# Altium project PCB_control_board_main.PrjPcb
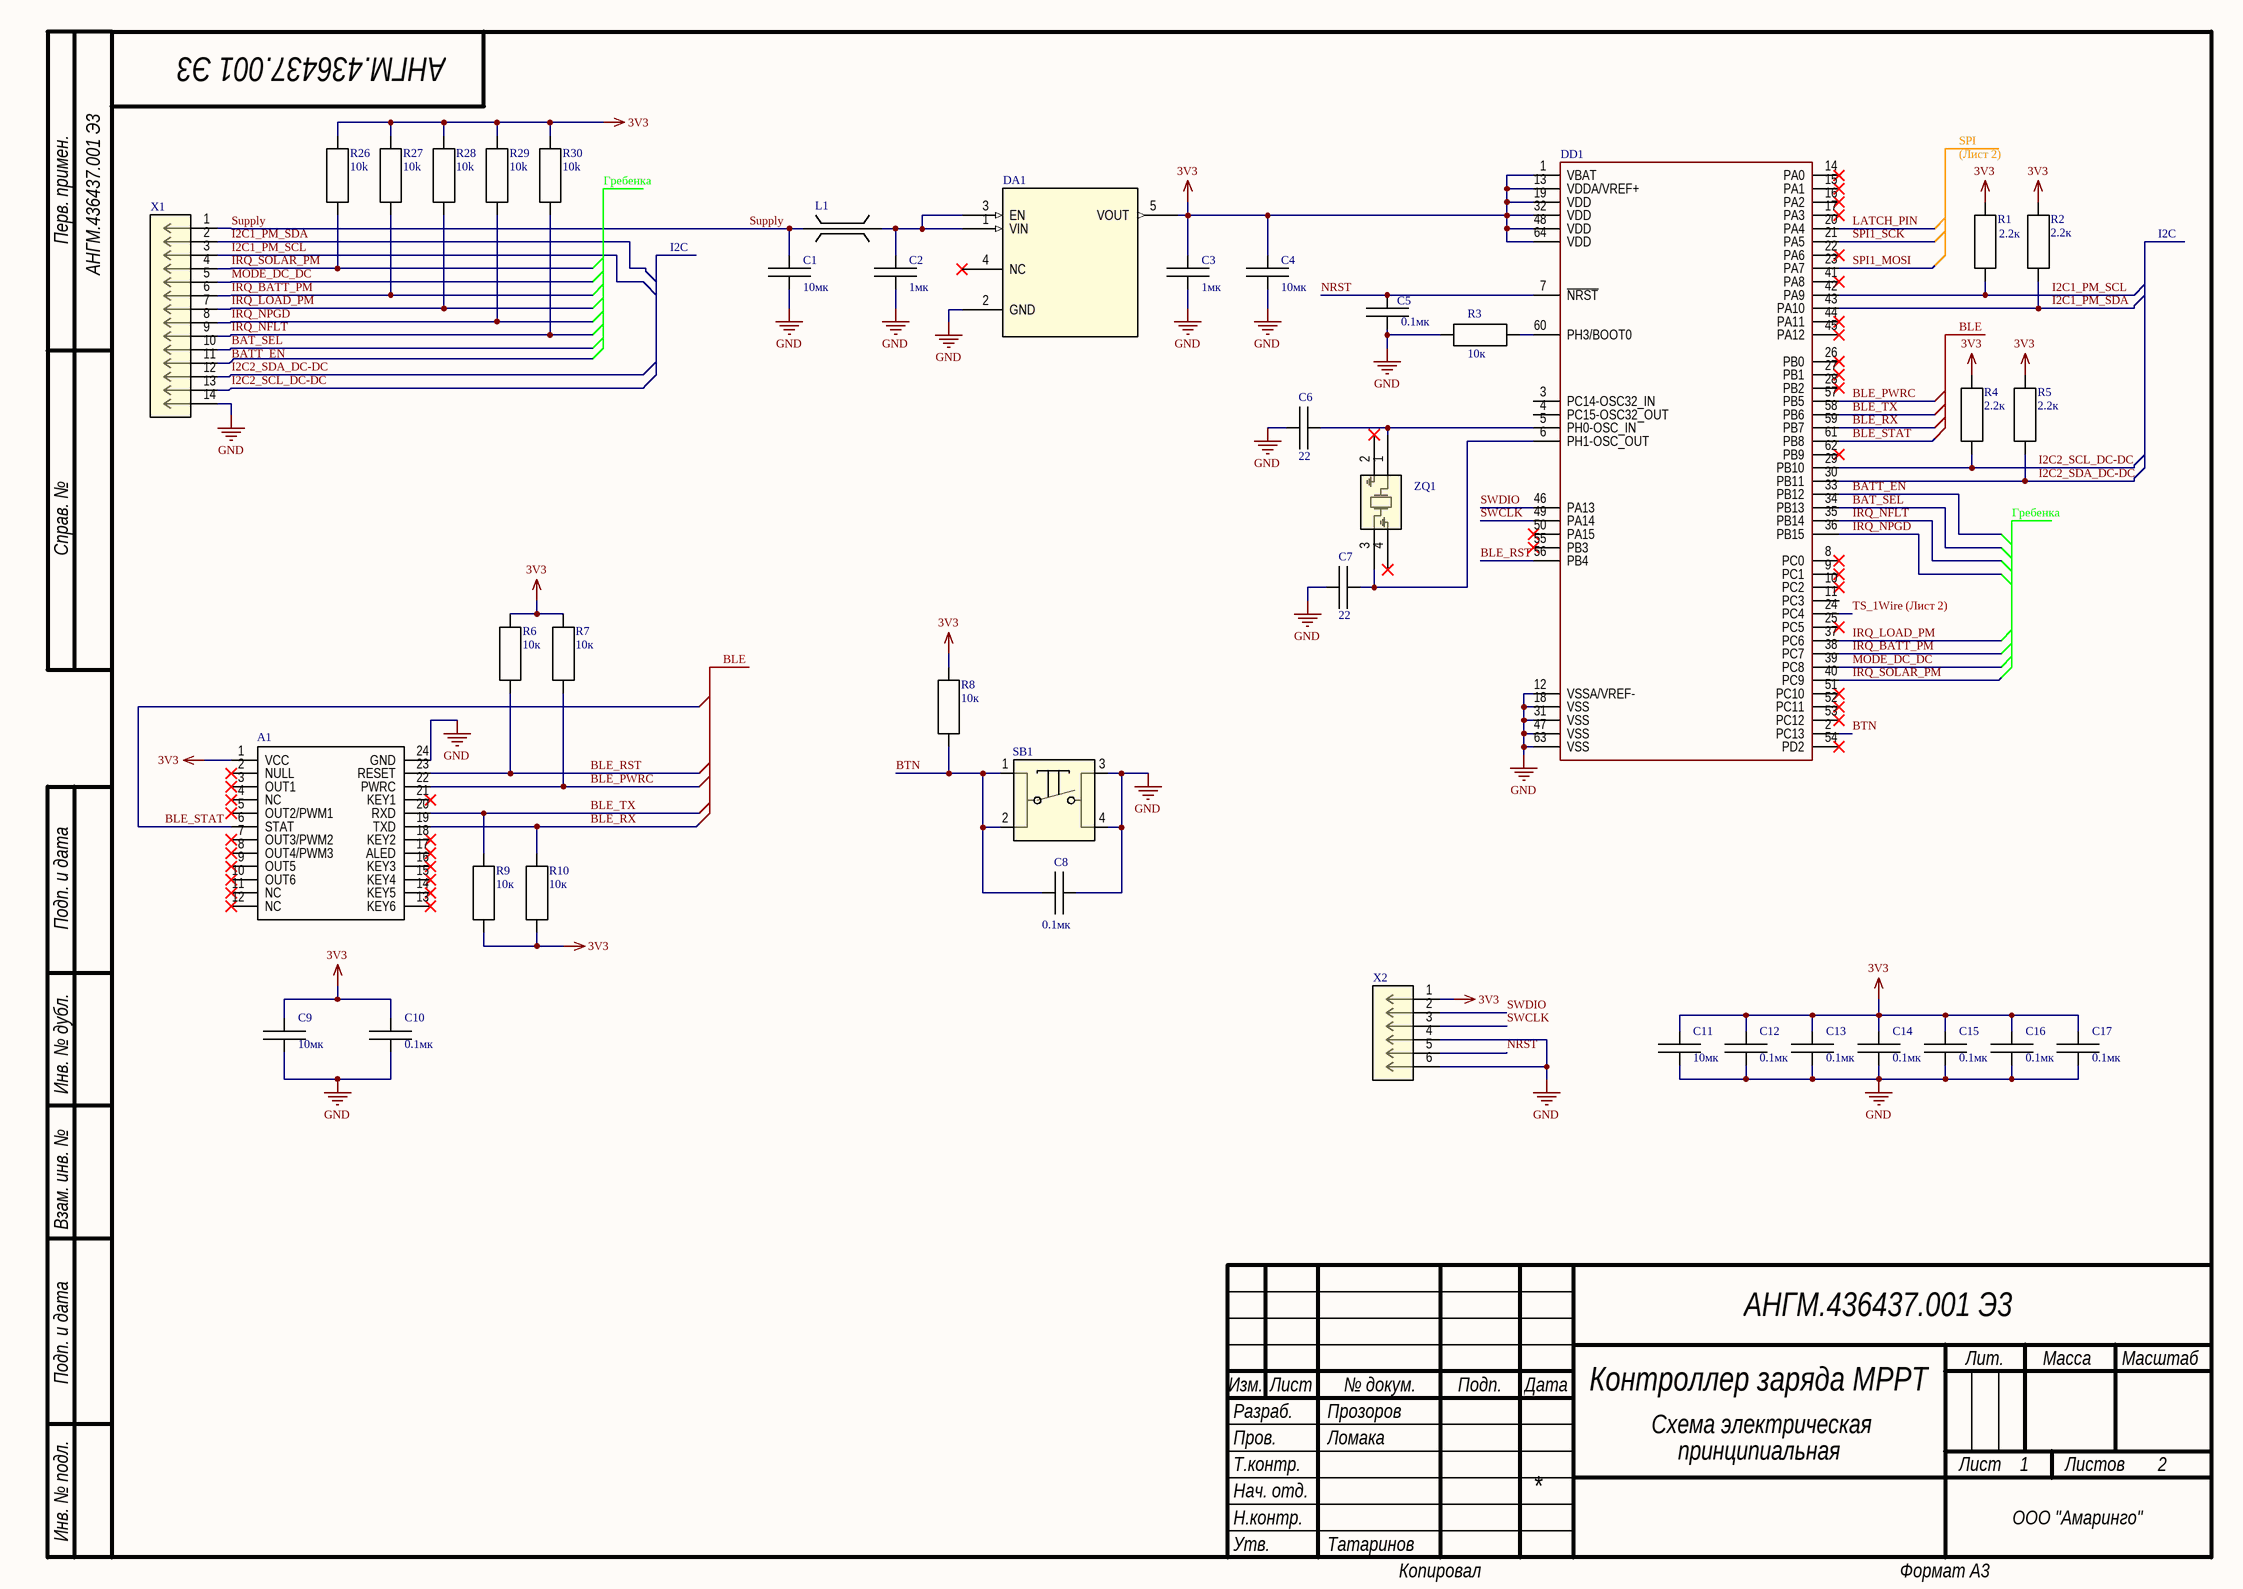
[diagram p0: stm32.SchDoc]
DecimalNumber: АНГО.436437.001; Вид_документа_SCH: Схема электрическая принципиальная; Графа 04 - Литера: О; Децимальный номер печатного узла: АНГО.436437.001; Код_документа_SCH: Э3; Компания: ООО "Амаринго"; Литера: О; Литера1: О; Наименование: Контроллер заряда MPPT; Наименование1: Контроллер заряда MPPT; Обозначение: АНГМ.436437.001; Обозначение_Код: АНГМ.436437.001Э3; Папка для сохранения графической документации: Документация; Папка для сохранения текстовой документации: Документация; Проверил: Ломака; Разработал: Прозоров; Характер_работы: Рук.Проекта; п_Пров_Р: Ломака П.С.; п_Разраб_Р: Прозоров Р.В.
2 sheets, 78 parts. Net scope: global (net labels, ports and power ports of the same name join across sheets).
Board file: PCB2.PcbDoc
Sheets:
  stm32.SchDoc
  indication.SchDoc

## Sheet stm32.SchDoc
size 420 x 297 mm; SheetNumber: 1; SheetTotal: 2; Scale: 1:1; Разраб.: Прозоров; Обозначение документа: АНГМ.436437.001 Э3; Пров.: Ломака; Утв.: Татаринов; Наименование организации: ООО "Амаринго"; Перв. применение: АНГМ.436437.001 Э3; Наименование изделия 1: Контроллер заряда MPPT; Наименование изделия 2: Схема электрическая; Наименование изделия 3: принципиальная; Нач. отд.: Нач. отд.

### Parts
A1  JDY-28M WAVGAT  [CAC-150P2011X1495-16N]  (value not drawn)
C1  value 10мк  [RES-0603N]  (hidden comment: TAJA106K016RNJ Kyocera AVX)
C2  value 1мк  [RES-0603N]  (hidden comment: GRM188R61E105KA12D Murata)
C3  value 1мк  [RES-0603N]  (hidden comment: GRM188R61E105KA12D Murata)
C4  TAJA106K016RNJ Kyocera AVX  [CAP-1206N]  (value not drawn)
C5  value 0.1мк  [RES-0603N]  (hidden comment: GRM188R71H104K Murata)
C6  value 22  [RES-0603N]  (hidden comment: CC0603FRNPO9BN220 Yageo)
C7  value 22  [RES-0603N]  (hidden comment: CC0603FRNPO9BN220 Yageo)
C8  value 0.1мк  [RES-0603N]  (hidden comment: GRM188R71H104K Murata)
C9  value 10мк  [CAP-1206N]  (hidden comment: TAJA106K016RNJ Kyocera AVX)
C10  value 0.1мк  [RES-0603N]  (hidden comment: GRM188R71H104K Murata)
C11  value 10мк  [CAP-1206N]  (hidden comment: TAJA106K016RNJ Kyocera AVX)
C12  value 0.1мк  [RES-0603N]  (hidden comment: GRM188R71H104K Murata)
C13  value 0.1мк  [RES-0603N]  (hidden comment: GRM188R71H104K Murata)
C14  value 0.1мк  [RES-0603N]  (hidden comment: GRM188R71H104K Murata)
C15  value 0.1мк  [RES-0603N]  (hidden comment: GRM188R71H104K Murata)
C16  value 0.1мк  [RES-0603N]  (hidden comment: GRM188R71H104K Murata)
C17  value 0.1мк  [RES-0603N]  (hidden comment: GRM188R71H104K Murata)
DA1  ADP150AUJZ-3.3-R7 Analog Devices  [UJ_5_ADI]  (value not drawn)
DD1  STM32L431RCT6 STMicroelectronics  [LQFP-64]  (value not drawn)
L1  BLM18AG601SN1D Murata Electronics  [FILTER_BLM18AG_MUR]  (value not drawn)
R1  value 2.2к  [RES-0603N]  (hidden comment: RC0603FR-072K2L Yageo)
R2  value 2.2к  [RES-0603N]  (hidden comment: RC0603FR-072K2L Yageo)
R3  value 10к  [RES-0603N]  (hidden comment: RC0603FR-0710KL Yageo)
R4  value 2.2к  [RES-0603N]  (hidden comment: RC0603FR-072K2L Yageo)
R5  value 2.2к  [RES-0603N]  (hidden comment: RC0603FR-072K2L Yageo)
R6  value 10к  [RES-0603N]  (hidden comment: RC0603FR-0710KL Yageo)
R7  value 10к  [RES-0603N]  (hidden comment: RC0603FR-0710KL Yageo)
R8  value 10к  [RES-0603N]  (hidden comment: RC0603FR-0710KL Yageo)
R9  value 10к  [RES-0603N]  (hidden comment: RC0603FR-0710KL Yageo)
R10  value 10к  [RES-0603N]  (hidden comment: RC0603FR-0710KL Yageo)
R26  value 10k  [RES-0603N]  (hidden comment: RC0603FR-0710KL Yageo)
R27  value 10k  [RES-0603N]  (hidden comment: RC0603FR-0710KL Yageo)
R28  value 10k  [RES-0603N]  (hidden comment: RC0603FR-0710KL Yageo)
R29  value 10k  [RES-0603N]  (hidden comment: RC0603FR-0710KL Yageo)
R30  value 10k  [RES-0603N]  (hidden comment: RC0603FR-0710KL Yageo)
SB1  KAN1211-1201B KAN  [SW4_PTS125SM432LFS_CNK]  (value not drawn)
X1  DS1021-2x7 Connfly  [CONN_215447-7_TEC]  (value not drawn)
X2  DS1022-1x6R Connfly  [CONN_2011-1X06G00SB_06P_OUP]  (value not drawn)
ZQ1  KSE-7I08000MAF343ZA3 KEEN SIDE  [C5S_5x3p2_SMD_AKR]  (value not drawn)

### Nets
3V3: A1.1(VCC) C3.2 C4.2 C9.2 C10.2 C11.2 C12.2 C13.2 C14.2 C15.2 C16.2 C17.2 DA1.5(VOUT) DD1.1(VBAT) DD1.13(VDDA/VREF+) DD1.19(VDD) DD1.32(VDD) DD1.48(VDD) DD1.64(VDD) R1.2 R2.2 R4.2 R5.2 R6.2 R7.2 R8.2 R9.1 R10.1 R26.2 R27.2 R28.2 R29.1 R30.1 X2.1
GND: A1.24(GND) C1.1 C2.1 C3.1 C4.1 C5.1 C6.1 C7.1 C8.2 C9.1 C10.1 C11.1 C12.1 C13.1 C14.1 C15.1 C16.1 C17.1 DA1.2(GND) DD1.12(VSSA/VREF-) DD1.18(VSS) DD1.31(VSS) DD1.47(VSS) DD1.63(VSS) R3.1 SB1.3 SB1.4 X1.14 X2.4 X2.6
BAT_SEL: DD1.34(PB13) X1.10
BATT_EN: DD1.33(PB12) X1.11
BLE_PWRC: A1.22(PWRC) DD1.57(PB5) R7.1
BLE_RST: A1.23(RESET) DD1.56(PB4) R6.1
BLE_RX: A1.19(TXD) DD1.59(PB7) R10.2
BLE_STAT: A1.6(STAT) DD1.61(PB8)
BLE_TX: A1.20(RXD) DD1.58(PB6) R9.2
BTN: C8.1 DD1.2(PC13) R8.1 SB1.1 SB1.2
I2C1_PM_SCL: DD1.42(PA9) R1.1 X1.3
I2C1_PM_SDA: DD1.43(PA10) R2.1 X1.2
I2C2_SCL_DC-DC: DD1.29(PB10) R4.1 X1.13
I2C2_SDA_DC-DC: DD1.30(PB11) R5.1 X1.12
IRQ_BATT_PM: DD1.38(PC7) R27.1 X1.6
IRQ_LOAD_PM: DD1.37(PC6) R28.1 X1.7
IRQ_NFLT: DD1.35(PB14) R30.2 X1.9
IRQ_NPGD: DD1.36(PB15) R29.2 X1.8
IRQ_SOLAR_PM: DD1.40(PC9) R26.1 X1.4
LATCH_PIN: DD1.20(PA4)
MODE_DC_DC: DD1.39(PC8) X1.5
NRST: C5.2 DD1.7(~{NRST}) X2.5
SPI1_MOSI: DD1.23(PA7)
SPI1_SCK: DD1.21(PA5)
Supply: C1.2 L1.1 X1.1
SWCLK: DD1.49(PA14) X2.3
SWDIO: DD1.46(PA13) X2.2
TS_1Wire: DD1.24(PC4)
NetC2_2: C2.2 DA1.1(VIN) DA1.3(EN) L1.2
NetC6_2: C6.2 DD1.5(PH0-OSC_IN) ZQ1.1(XTAL)
NetC7_2: C7.2 DD1.6(PH1-OSC_OUT) ZQ1.3(XTAL)
NetDD1_60: DD1.60(PH3/BOOT0) R3.2

Not connected (* = marked no-connect by the designer): A1 2(NULL)* 3(OUT1)* 4(NC)* 5(OUT2/PWM1)* 7(OUT3/PWM2)* 8(OUT4/PWM3)* 9(OUT5)* 10(OUT6)* 11(NC)* 12(NC)* 13(KEY6)* 14(KEY5)* 15(KEY4)* 16(KEY3)* 17(ALED)* 18(KEY2)* 21(KEY1)*; DA1 4(NC)*; DD1 3(PC14-OSC32_IN) 4(PC15-OSC32_OUT) 8(PC0)* 9(PC1)* 10(PC2)* 11(PC3) 14(PA0)* 15(PA1)* 16(PA2)* 17(PA3)* 22(PA6)* 25(PC5)* 26(PB0)* 27(PB1)* 28(PB2)* 41(PA8)* 44(PA11)* 45(PA12)* 50(PA15)* 51(PC10)* 52(PC11)* 53(PC12)* 54(PD2)* 55(PB3)* 62(PB9)*; ZQ1 2(GND)* 4(GND)*

### Notes on the sheet
- (near R30) Гребенка
- SPI
- (Лист 2)
- I2C
- BLE
- Гребенка
- Перв. примен.
- Справ. №
- Подп. и дата
- Инв. № дубл.
- Взам. инв. №
- Разраб.
- Изм.
- Лист
- № докум.
- Подп.
- Дата
- Лит.
- Масса
- Масштаб
- Пров.
- Т.контр.
- Листов
- Инв. № подл.
- Утв.
- Н.контр.
- Копировал
- Формат А3
- (in symbol CAP) 10мк

### Library data of the parts
A1 = JDY-28M: Group: Модуль; Name: JDY-28M WAVGAT
C1 C4 C9 C11 = CAP: Group: Конденсатор; Причечание: 10 мкФ - 16 В - тип A ±10% танталовый; Name: TAJA106K016RNJ Kyocera AVX
C2 C3 = CAP: Group: Конденсатор; Причечание: 1 мкФ - 25 В - X5R ±10%; Name: GRM188R61E105KA12D Murata
C5 C8 C10 C12-C17 = CAP: Group: Конденсатор; Причечание: 0.1 мкФ - 50 В - X7R ±10%; Name: GRM188R71H104K Murata
C6 C7 = CAP: Group: Конденсатор; Причечание: 22 пФ - 50 В - NP0 ±1%; Name: CC0603FRNPO9BN220 Yageo
DA1 = ADP150AUJZ-3.3-R7: Ultralow Noise, 150 mA CMOS Linear Regulator; Manufacturer_Name: Analog Devices Inc; Group: Микросхема; Причечание: Линейный стабилизатор 3.3В; Copyright: Copyright (C) 2025 Ultra Librarian. All rights reserved.; Manufacturer_Part_Number: ADP150AUJZ-3.3-R7; RefDes: RefDes; Type: Type; Name: ADP150AUJZ-3.3-R7 Analog Devices
DD1 = STM32L431RCT6: Group: Микросхема; Причечание: Микроконтроллер ARM 32-bit Cortex-M4; Name: STM32L431RCT6 STMicroelectronics
L1 = BLM18AG601SN1D: Group: Дроссель; Причечание: Дроссель подавления ЭМП 600 Ом, 0.5А; Name: BLM18AG601SN1D Murata Electronics
R1 R2 R4 R5 = RES: Group: Резистор; Причечание: 0.1 Вт - 2.2 кОм ±1%; Name: RC0603FR-072K2L Yageo
R3 R6-R10 R26-R30 = RES: Group: Резистор; Причечание: 0.1 Вт - 10 кОм ±1%; Name: RC0603FR-0710KL Yageo
SB1 = KAN1211-1201B: Manufacturer_Name: C&K Components; Manufacturer_Part_Number: PTS125SM432LFS; Group: Кнопка; Причечание: Кнопка тактовая 12x12x12 мм; Copyright: Copyright (C) 2025 Ultra Librarian. All rights reserved.; Name: KAN1211-1201B KAN
X1 = 215447-7: 2x7 POS AMPMODU MOD II HDR ACTION PIN; Manufacturer_Name: TE Connectivity; Group: Вилка; Причечание: Вилка штыревая прямая 2.54мм 2x7 pin; Copyright: Copyright (C) 2025 Ultra Librarian. All rights reserved.; Manufacturer_Part_Number: 215447-7; RefDes: RefDes; Type: Type; Name: DS1021-2x7 Connfly
X2 = 2011-1X06G00SB: KLS1-207-1-06-S, Вилка штыревая 2.54мм 1x6 угловая; Manufacturer_Name: Oupiin; Причечание: Вилка штыревая угловая 2.54мм 1x6 pin; Copyright: Copyright (C) 2025 Ultra Librarian. All rights reserved.; Manufacturer_Part_Number: 2011-1X06G00SB; RefDes: RefDes; Type: Type; Group: Вилка; Name: DS1022-1x6R Connfly
ZQ1 = C5S-8.000-18-3030-X-R: KSE-7I08000MAF343ZA3; Manufacturer_Name: Aker; Group: Резонатор; Copyright: Copyright (C) 2025 Ultra Librarian. All rights reserved.; Manufacturer_Part_Number: C5S-8.000-18-3030-X-R; RefDes: RefDes; Type: Type; Name: KSE-7I08000MAF343ZA3 KEEN SIDE

## Sheet indication.SchDoc
size 420 x 297 mm; SheetNumber: 2; SheetTotal: 2; Scale: 1:1; Обозначение документа: АНГМ.436437.001 Э3
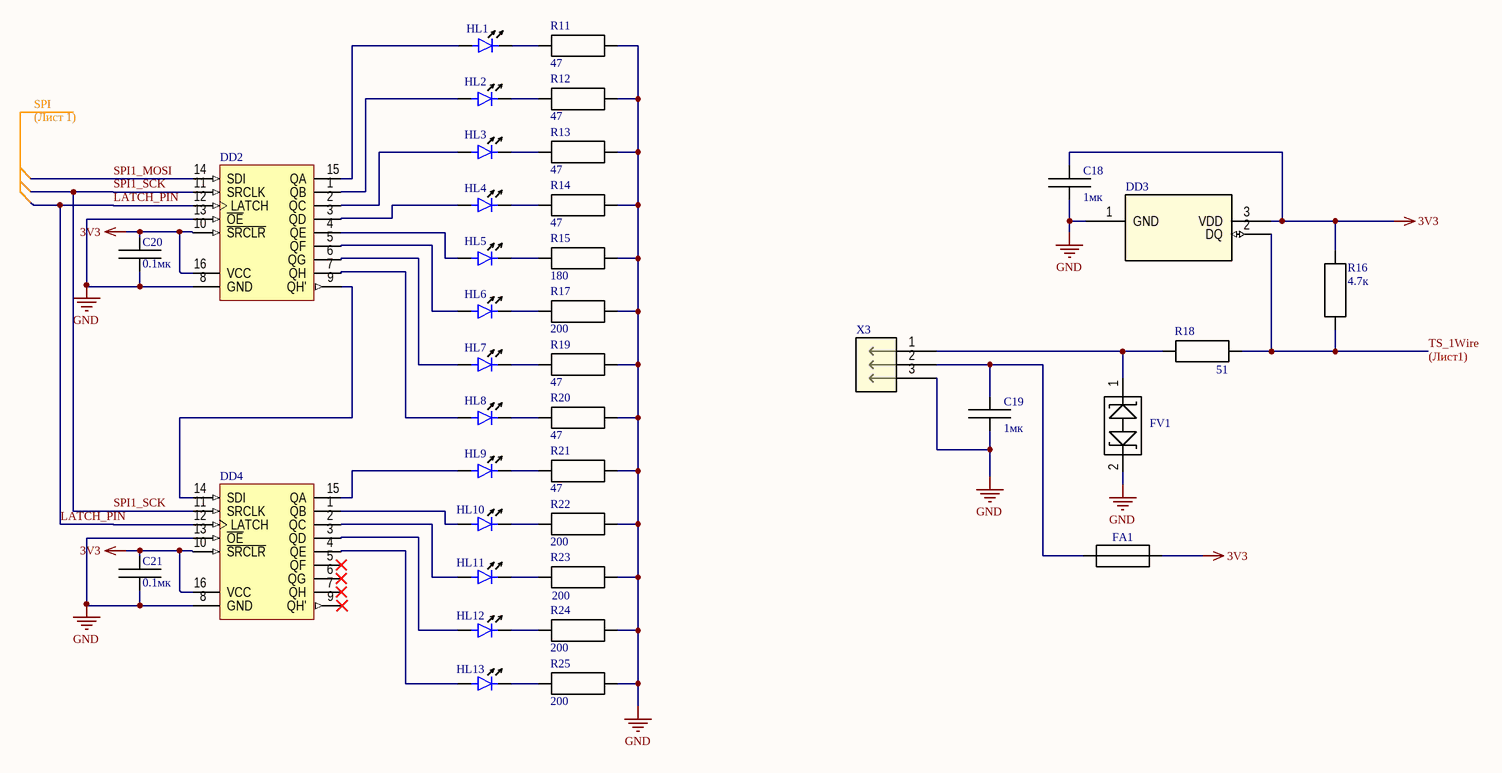
[diagram p1: indication.SchDoc]

### Parts
C18  value 1мк  [RES-0603N]  (hidden comment: GRM188R71H104K Murata)
C19  value 1мк  [RES-0603N]  (hidden comment: GRM188R71H104K Murata)
C20  value 0.1мк  [RES-0603N]  (hidden comment: GRM188R71H104K Murata)
C21  value 0.1мк  [RES-0603N]  (hidden comment: GRM188R71H104K Murata)
DD2  74HC595D Nexperia  [SO-16]  (value not drawn)
DD3  NS18B20-QTOS Novosense  [21-0248A_Q3-1_MXM]  (value not drawn)
DD4  74HC595D Nexperia  [SO-16]  (value not drawn)
FA1  MF-R005-0 Bourns  [FUSE_MF-R050-0-17_BRN]  (value not drawn)
FV1  PESD3V3L1BA Keen Side  [SOD323_NEX]  (value not drawn)
HL1  APTD3216LCGCK Kingbright  [LED-1206N]  (value not drawn)
HL2  APTD3216LCGCK Kingbright  [LED-1206N]  (value not drawn)
HL3  APTD3216LCGCK Kingbright  [LED-1206N]  (value not drawn)
HL4  APTD3216LCGCK Kingbright  [LED-1206N]  (value not drawn)
HL5  APTD3216LSYCK Kingbright  [LED-1206N]  (value not drawn)
HL6  APTD2012LSURCK Kingbright  [LED-0805N]  (value not drawn)
HL7  APTD3216LCGCK Kingbright  [LED-1206N]  (value not drawn)
HL8  APTD3216LCGCK Kingbright  [LED-1206N]  (value not drawn)
HL9  APTD3216LCGCK Kingbright  [LED-1206N]  (value not drawn)
HL10  APTD2012LSURCK Kingbright  [LED-0805N]  (value not drawn)
HL11  APTD2012LSURCK Kingbright  [LED-0805N]  (value not drawn)
HL12  APTD2012LSURCK Kingbright  [LED-0805N]  (value not drawn)
HL13  APTD2012LSURCK Kingbright  [LED-0805N]  (value not drawn)
R11  value 47  [RES-0603N]  (hidden comment: RC0603FR-0747RL Yageo)
R12  value 47  [RES-0603N]  (hidden comment: RC0603FR-0747RL Yageo)
R13  value 47  [RES-0603N]  (hidden comment: RC0603FR-0747RL Yageo)
R14  value 47  [RES-0603N]  (hidden comment: RC0603FR-0747RL Yageo)
R15  value 180  [RES-0603N]  (hidden comment: RC0603FR-07180RL Yageo)
R16  value 4.7к  [RES-0603N]  (hidden comment: RC0603FR-074K7L Yageo)
R17  value 200  [RES-0603N]  (hidden comment: RC0603FR-07200RL Yageo)
R18  value 51  [RES-0603N]  (hidden comment: RC0603FR-0751RL Yageo)
R19  value 47  [RES-0603N]  (hidden comment: RC0603FR-0747RL Yageo)
R20  value 47  [RES-0603N]  (hidden comment: RC0603FR-0747RL Yageo)
R21  value 47  [RES-0603N]  (hidden comment: RC0603FR-0747RL Yageo)
R22  value 200  [RES-0603N]  (hidden comment: RC0603FR-07200RL Yageo)
R23  value 200  [RES-0603N]  (hidden comment: RC0603FR-07200RL Yageo)
R24  value 200  [RES-0603N]  (hidden comment: RC0603FR-07200RL Yageo)
R25  value 200  [RES-0603N]  (hidden comment: RC0603FR-07200RL Yageo)
X3  DS1110-01-3 Connfly  [CONN3_1546551-3_TEC]  (value not drawn)

### Nets
3V3: C18.1 C20.2 C21.2 DD2.10(~{SRCLR}) DD2.16(VCC) DD3.3(VDD) DD4.10(~{SRCLR}) DD4.16(VCC) FA1.2 R16.2
GND: C18.2 C19.2 C20.1 C21.1 DD2.8(GND) DD2.13(~{OE}) DD3.1(GND) DD4.8(GND) DD4.13(~{OE}) FV1.2 R11.2 R12.2 R13.2 R14.2 R15.2 R17.2 R19.2 R20.2 R21.2 R22.2 R23.2 R24.2 R25.2 X3.3
LATCH_PIN: DD2.12(LATCH) DD4.12(LATCH)
SPI1_MOSI: DD2.14(SDI)
SPI1_SCK: DD2.11(SRCLK) DD4.11(SRCLK)
TS_1Wire: DD3.2(DQ) R16.1 R18.2
NetC19_1: C19.1 FA1.1 X3.2
NetDD2_1: DD2.1(QB) HL2.1(Anode)
NetDD2_2: DD2.2(QC) HL3.1(Anode)
NetDD2_3: DD2.3(QD) HL4.1(Anode)
NetDD2_4: DD2.4(QE) HL5.1(Anode)
NetDD2_5: DD2.5(QF) HL6.1(Anode)
NetDD2_6: DD2.6(QG) HL7.1(Anode)
NetDD2_7: DD2.7(QH) HL8.1(Anode)
NetDD2_9: DD2.9(QH') DD4.14(SDI)
NetDD2_15: DD2.15(QA) HL1.1(Anode)
NetDD4_1: DD4.1(QB) HL10.1(Anode)
NetDD4_2: DD4.2(QC) HL11.1(Anode)
NetDD4_3: DD4.3(QD) HL12.1(Anode)
NetDD4_4: DD4.4(QE) HL13.1(Anode)
NetDD4_15: DD4.15(QA) HL9.1(Anode)
NetFV1_1: FV1.1 R18.1 X3.1
NetHL1_2: HL1.2(Cathode) R11.1
NetHL2_2: HL2.2(Cathode) R12.1
NetHL3_2: HL3.2(Cathode) R13.1
NetHL4_2: HL4.2(Cathode) R14.1
NetHL5_2: HL5.2(Cathode) R15.1
NetHL6_2: HL6.2(Cathode) R17.1
NetHL7_2: HL7.2(Cathode) R19.1
NetHL8_2: HL8.2(Cathode) R20.1
NetHL9_2: HL9.2(Cathode) R21.1
NetHL10_2: HL10.2(Cathode) R22.1
NetHL11_2: HL11.2(Cathode) R23.1
NetHL12_2: HL12.2(Cathode) R24.1
NetHL13_2: HL13.2(Cathode) R25.1

Not connected (* = marked no-connect by the designer): DD4 5(QF)* 6(QG)* 7(QH)* 9(QH')*

### Notes on the sheet
- SPI
- (Лист 1)
- (Лист1)
- Подп. и дата
- Инв. № дубл.
- Взам. инв. №
- Инв. № подл.
- Изм.
- Лист
- № докум.
- Подп.
- Дата
- Копировал
- Формат А3

### Library data of the parts
C18 C19 = CAP: Group: Конденсатор; Name: GRM188R61E105KA12D Murata; Причечание: 1 мкФ - 25 В - X5R ±10%
C20 C21 = CAP: as C5 on sheet stm32; Name: GRM188R71H104K Murata
DD2 DD4 = 74HC595: 8-Bit Shift Register with 3-State Output Registers; OriginalSource: AltTab; Group: Микросхема; Причечание: 8-битный сдвиговый регистр; Order: *; Name: 74HC595D Nexperia
DD3 = DS18B20+: Programmable Resolution 1-Wire Digital Thermometer; Manufacturer_Name: Analog Devices Inc; Group: Микросхема; Причечание: Высокоточный датчик температуры; Copyright: Copyright (C) 2025 Ultra Librarian. All rights reserved.; Manufacturer_Part_Number: DS18B20+; RefDes: RefDes; Type: Type; Name: NS18B20-QTOS Novosense
FA1 = MF-R050-0-17: Manufacturer_Name: Bourns Electronics; Group: Предохранитель; Причечание: Самовосстанавливающийся 0.05А; Copyright: Copyright (C) 2025 Ultra Librarian. All rights reserved.; Manufacturer_Part_Number: MF-R050-0-17; Name: MF-R005-0 Bourns
FV1 = PESD3V3L1BA: Description; Manufacturer_Name: Nexperia; Group: Диод; Причечание: TVS-диод (защита от ESD) 3.3В; Copyright: Copyright (C) 2025 Ultra Librarian. All rights reserved.; Manufacturer_Part_Number: PESD3V3L1BA; Name: PESD3V3L1BA Keen Side
HL1-HL4 HL7-HL9 = LED: Light Emittering Diode; PartValue: LED*0603 *; OriginalSource: AltTab; Group: Диод; Причечание: Светодиод зеленый; Order: *; Package: *0603; Wavelength: *; LCSC Part #: *; Name: APTD3216LCGCK Kingbright
HL5 = LED: Light Emittering Diode; PartValue: LED*0603 *; OriginalSource: AltTab; Group: Диод; Причечание: Светодиод желтый; Order: *; Package: *0603; Wavelength: *; LCSC Part #: *; Name: APTD3216LSYCK Kingbright
HL6 HL10-HL13 = LED: Light Emittering Diode; PartValue: LED*0603 *; OriginalSource: AltTab; Group: Диод; Причечание: Светодиод красный; Order: *; Package: *0603; Wavelength: *; LCSC Part #: *; Name: APTD2012LSURCK Kingbright
R11-R14 R19-R21 = RES: Group: Резистор; Причечание: 0.1 Вт - 47 Ом ±1%; Name: RC0603FR-0747RL Yageo
R15 = RES: Group: Резистор; Причечание: 0.1 Вт - 180 Ом ±1%; Name: RC0603FR-07180RL Yageo
R16 = RES: Group: Резистор; Причечание: 0.1 Вт - 4.7 кОм ±1%; Name: RC0603FR-074K7L Yageo
R17 R22-R25 = RES: Group: Резистор; Причечание: 0.1 Вт - 200 Ом ±1%; Name: RC0603FR-07200RL Yageo
R18 = RES: Group: Резистор; Причечание: 0.1 Вт - 51 Ом ±1%; Name: RC0603FR-0751RL Yageo
X3 = 1546551-3: 3P,STRAIGHT,SIDE ENTRY,3.5MM; Manufacturer_Name: TE Connectivity; Group: Вилка; Причечание: Разъем миниатюрный 3 pin; Copyright: Copyright (C) 2026 Ultra Librarian. All rights reserved.; Manufacturer_Part_Number: 1546551-3; RefDes: RefDes; Type: Type; Name: DS1110-01-3 Connfly

## Nets that join several sheets
3V3: stm32 (34 pins), indication (10 pins)
GND: stm32 (30 pins), indication (24 pins)
LATCH_PIN: stm32 (DD1.20), indication (DD2.12 DD4.12)
SPI1_MOSI: stm32 (DD1.23), indication (DD2.14)
SPI1_SCK: stm32 (DD1.21), indication (DD2.11 DD4.11)
TS_1Wire: stm32 (DD1.24), indication (DD3.2 R16.1 R18.2)